# Altium project OFP_VIM_v1.51.PrjPcb (part 3 of 3)
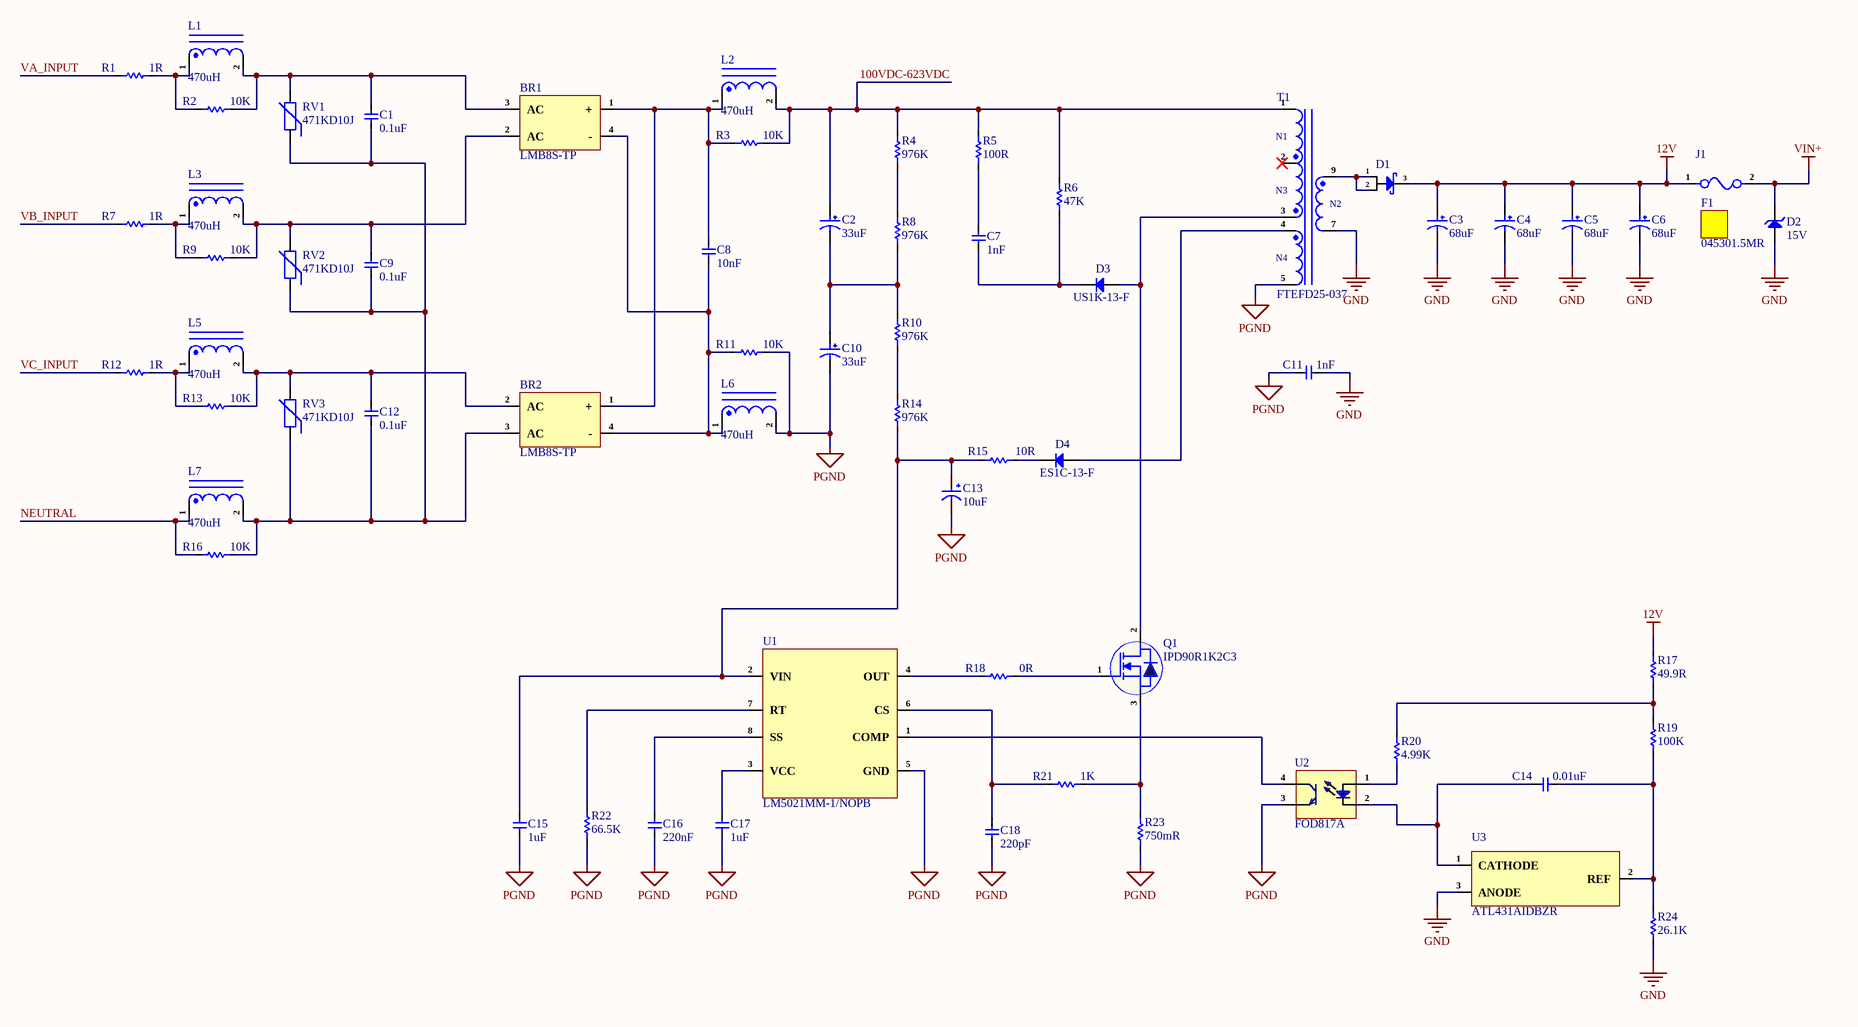
[diagram p3: Power-Supply-Sheet.SchDoc]

## Sheet Power-Supply-Sheet.SchDoc (continued)

### Library data of the parts (continued)
R24 = RT0603BRD0726K1L: RES SMD 26.1KOHM 0.1% 1/10W 0603; Manufacturer: Yageo; Item Type: Resistors; Supplier: Future Electronics; LCSC Part Number: C728586; Manufacturer Part Number: RT0603BRD0726K1L; RoHS: Yes; Stock: 40000; Pricing: 5000=0.0192, 15000=0.0188, 20000=0.0186, 50000=0.0183, 75000=0.0179 (USD); ComponentLink1URL: https://datasheet.ciiva.com/12809/pyu-rt-1-to-0-05-rohs-l-4-12809765.pdf?src-supplier=Mouser; ComponentLink1Description: https://datasheet.ciiva.com/12809/pyu-rt-1-to-0-05-rohs-l-4-12809765.pdf?src-supplier=Mouser; ComponentLink2URL: https://datasheet.ciiva.com/8889/pyu-rt-1-to-0-05-rohs-l-4-8889966.pdf?src-supplier=Avnet; ComponentLink2Description: https://datasheet.ciiva.com/8889/pyu-rt-1-to-0-05-rohs-l-4-8889966.pdf?src-supplier=Avnet
RV1-RV3 = 471KD10J: 775V 385V 300V 470V Plugin Varistors ROHS; Manufacturer: Yageo; Supplier: Mouser; LCSC Part Number: C522648; Manufacturer Part Number: 471KD10J; RoHS: Yes; Item Type: Varistors; Stock: 1519; Pricing: 1=0.43, 10=0.27, 50=0.27, 100=0.187, 1000=0.145, 10000=0.096 (USD)
T1 = FTEFD25-037: 12V/1.5A transformer; Manufacturer Part Number: FTEFD25-037; Package: Custom; Item Type: Transformer
U1 = LM5021MM-1/NOPB: IC OFFLINE SW MULT TOP 8VSSOP; Manufacturer: TI National Semiconductor; Frequency: 500kHz; Output Voltage: 600mV; Output Current: 100mA; Switching Frequency: 1MHz; Quiescent Current: 2.5mA; Topology: Flyback; Max Supply Voltage: 30V; Min Supply Voltage: 8V; Rise Time: 25ns; Fall Time: 10ns; Duty Cycle: 80%; Nominal Supply Voltage: 15V; Supplier: Mouser; LCSC Part Number: C202233; Manufacturer Part Number: LM5021MM-1/NOPB; RoHS: Yes; Item Type: IC; Stock: 1237; Pricing: 1=1.4, 10=1.04, 50=1.04, 100=0.968, 1000=0.887, 10000=0.856 (USD); Mounting Technology: Surface Mount; Case/Package: MSOP; Pins: 8; Min Operating Temperature: -40°C; Max Operating Temperature: 125°C; Packaging: Tape and Reel; Termination: SMD/SMT; Series: -; Thickness: 970um; Reach SVHC Compliant: No; Lead Free: Lead Free; RoHS Compliant: Yes; ComponentLink1URL: https://datasheet.ciiva.com/1513/1771307-1513330.pdf?src-supplier=Element14; ComponentLink1Description: https://datasheet.ciiva.com/1513/1771307-1513330.pdf?src-supplier=Element14; ComponentLink2URL: https://datasheet.ciiva.com/49118/1767118-49118582.pdf?src-supplier=Element14; ComponentLink2Description: https://datasheet.ciiva.com/49118/1767118-49118582.pdf?src-supplier=Element14; ComponentLink3URL: https://datasheet.ciiva.com/49118/1767118-49118263.pdf?src-supplier=Element14; ComponentLink3Description: https://datasheet.ciiva.com/49118/1767118-49118263.pdf?src-supplier=Element14; ComponentLink4URL: https://datasheet.ciiva.com/46389/1888908-46389836.pdf?src-supplier=Element14; ComponentLink4Description: https://datasheet.ciiva.com/46389/1888908-46389836.pdf?src-supplier=Element14; ComponentLink5URL: https://datasheet.ciiva.com/6613/lm5021-6613338.pdf?src-supplier=Digikey; ComponentLink5Description: https://datasheet.ciiva.com/6613/lm5021-6613338.pdf?src-supplier=Digikey; ComponentLink6URL: https://datasheet.ciiva.com/6613/lm5021-6613340.pdf?src-supplier=Digikey; ComponentLink6Description: https://datasheet.ciiva.com/6613/lm5021-6613340.pdf?src-supplier=Digikey; ComponentLink7URL: https://datasheet.ciiva.com/6613/lm5021-6613336.pdf?src-supplier=Digikey; ComponentLink7Description: https://datasheet.ciiva.com/6613/lm5021-6613336.pdf?src-supplier=Digikey
U2 = FOD817A: OPTOISOLATOR 5KV TRANSISTOR 4DIP; Manufacturer: ON Semiconductor / Fairchild; Item Type: IC; Supplier: Future Electronics; LCSC Part Number: C900909; Manufacturer Part Number: FOD817A; RoHS: Yes; Stock: 9100; Pricing: 100=0.0832, 500=0.0801, 2500=0.0771, 10000=0.0747, 25000=0.0712 (USD); ComponentLink1URL: https://datasheet.ciiva.com/25620/0900766b810e24fa-25620684.pdf?src-supplier=Rs; ComponentLink1Description: https://datasheet.ciiva.com/25620/0900766b810e24fa-25620684.pdf?src-supplier=Rs; ComponentLink2URL: https://datasheet.ciiva.com/15118/getdatasheetpartid-67083-15118459.pdf?src-supplier=Verical; ComponentLink2Description: https://datasheet.ciiva.com/15118/getdatasheetpartid-67083-15118459.pdf?src-supplier=Verical; ComponentLink3URL: https://datasheet.ciiva.com/27056/2016920-27056231.pdf?src-supplier=Jameco; ComponentLink3Description: https://datasheet.ciiva.com/27056/2016920-27056231.pdf?src-supplier=Jameco; ComponentLink4URL: https://datasheet.ciiva.com/12239/fod817a-12239227.pdf?src-supplier=Mouser; ComponentLink4Description: https://datasheet.ciiva.com/12239/fod817a-12239227.pdf?src-supplier=Mouser; ComponentLink5URL: https://datasheet.ciiva.com/8095/fod817d-8095131.pdf?src-supplier=Avnet; ComponentLink5Description: https://datasheet.ciiva.com/8095/fod817d-8095131.pdf?src-supplier=Avnet; ComponentLink6URL: https://datasheet.ciiva.com/2086/fod814a-2086034.pdf?src-supplier=Digikey; ComponentLink6Description: https://datasheet.ciiva.com/2086/fod814a-2086034.pdf?src-supplier=Digikey; ComponentLink7URL: https://datasheet.ciiva.com/16741/fod817-16741992.pdf?src-supplier=Future+Electronics; ComponentLink7Description: https://datasheet.ciiva.com/16741/fod817-16741992.pdf?src-supplier=Future+Electronics
U3 = ATL431AIDBZR: IC VREF SHUNT ADJ 1% SOT23-3; Manufacturer: Texas Instruments; Supplier: Mouser; LCSC Part Number: C134067; Manufacturer Part Number: ATL431AIDBZR; RoHS: Yes; Item Type: IC; Stock: 1938; Pricing: 1=0.41, 10=0.252, 50=0.252, 100=0.202, 1000=0.184, 10000=0.15 (USD); Length: 2.92mm; Width: 1.3mm; Height: 1.22mm; Thickness: 1mm; Lead Free: 5697LeadFree; ComponentLink1URL: http://www.ti.com/general/docs/lit/getliterature.tsp?genericPartNumber=ATL431&&fileType=pdf&src-supplier=Element14; ComponentLink1Description: http://www.ti.com/general/docs/lit/getliterature.tsp?genericPartNumber=ATL431&&fileType=pdf&src-supplier=Element14; ComponentLink2URL: http://www.ti.com/general/docs/lit/getliterature.tsp?genericPartNumber=ATL431&amp;&amp;fileType=pdf&src-supplier=Element14; ComponentLink2Description: http://www.ti.com/general/docs/lit/getliterature.tsp?genericPartNumber=ATL431&amp;&amp;fileType=pdf&src-supplier=Element14; ComponentLink3URL: http://www.ti.com/lit/ds/symlink/atl431.pdf?src-supplier=Digikey; ComponentLink3Description: http://www.ti.com/lit/ds/symlink/atl431.pdf?src-supplier=Digikey; ComponentLink4URL: http://www.ti.com/general/docs/lit/getliterature.tsp?genericPartNumber=ATL432&&fileType=pdf&src-supplier=Avnet; ComponentLink4Description: http://www.ti.com/general/docs/lit/getliterature.tsp?genericPartNumber=ATL432&&fileType=pdf&src-supplier=Avnet; ComponentLink5URL: http://www.ti.com/general/docs/lit/getliterature.tsp?genericPartNumber=ATL431&&fileType=pdf&src-supplier=Farnell; ComponentLink5Description: http://www.ti.com/general/docs/lit/getliterature.tsp?genericPartNumber=ATL431&&fileType=pdf&src-supplier=Farnell

## Sheet INPUT-Connectors-Sheet.SchDoc
size 420 x 297 mm; SheetNumber: 2; SheetTotal: 2
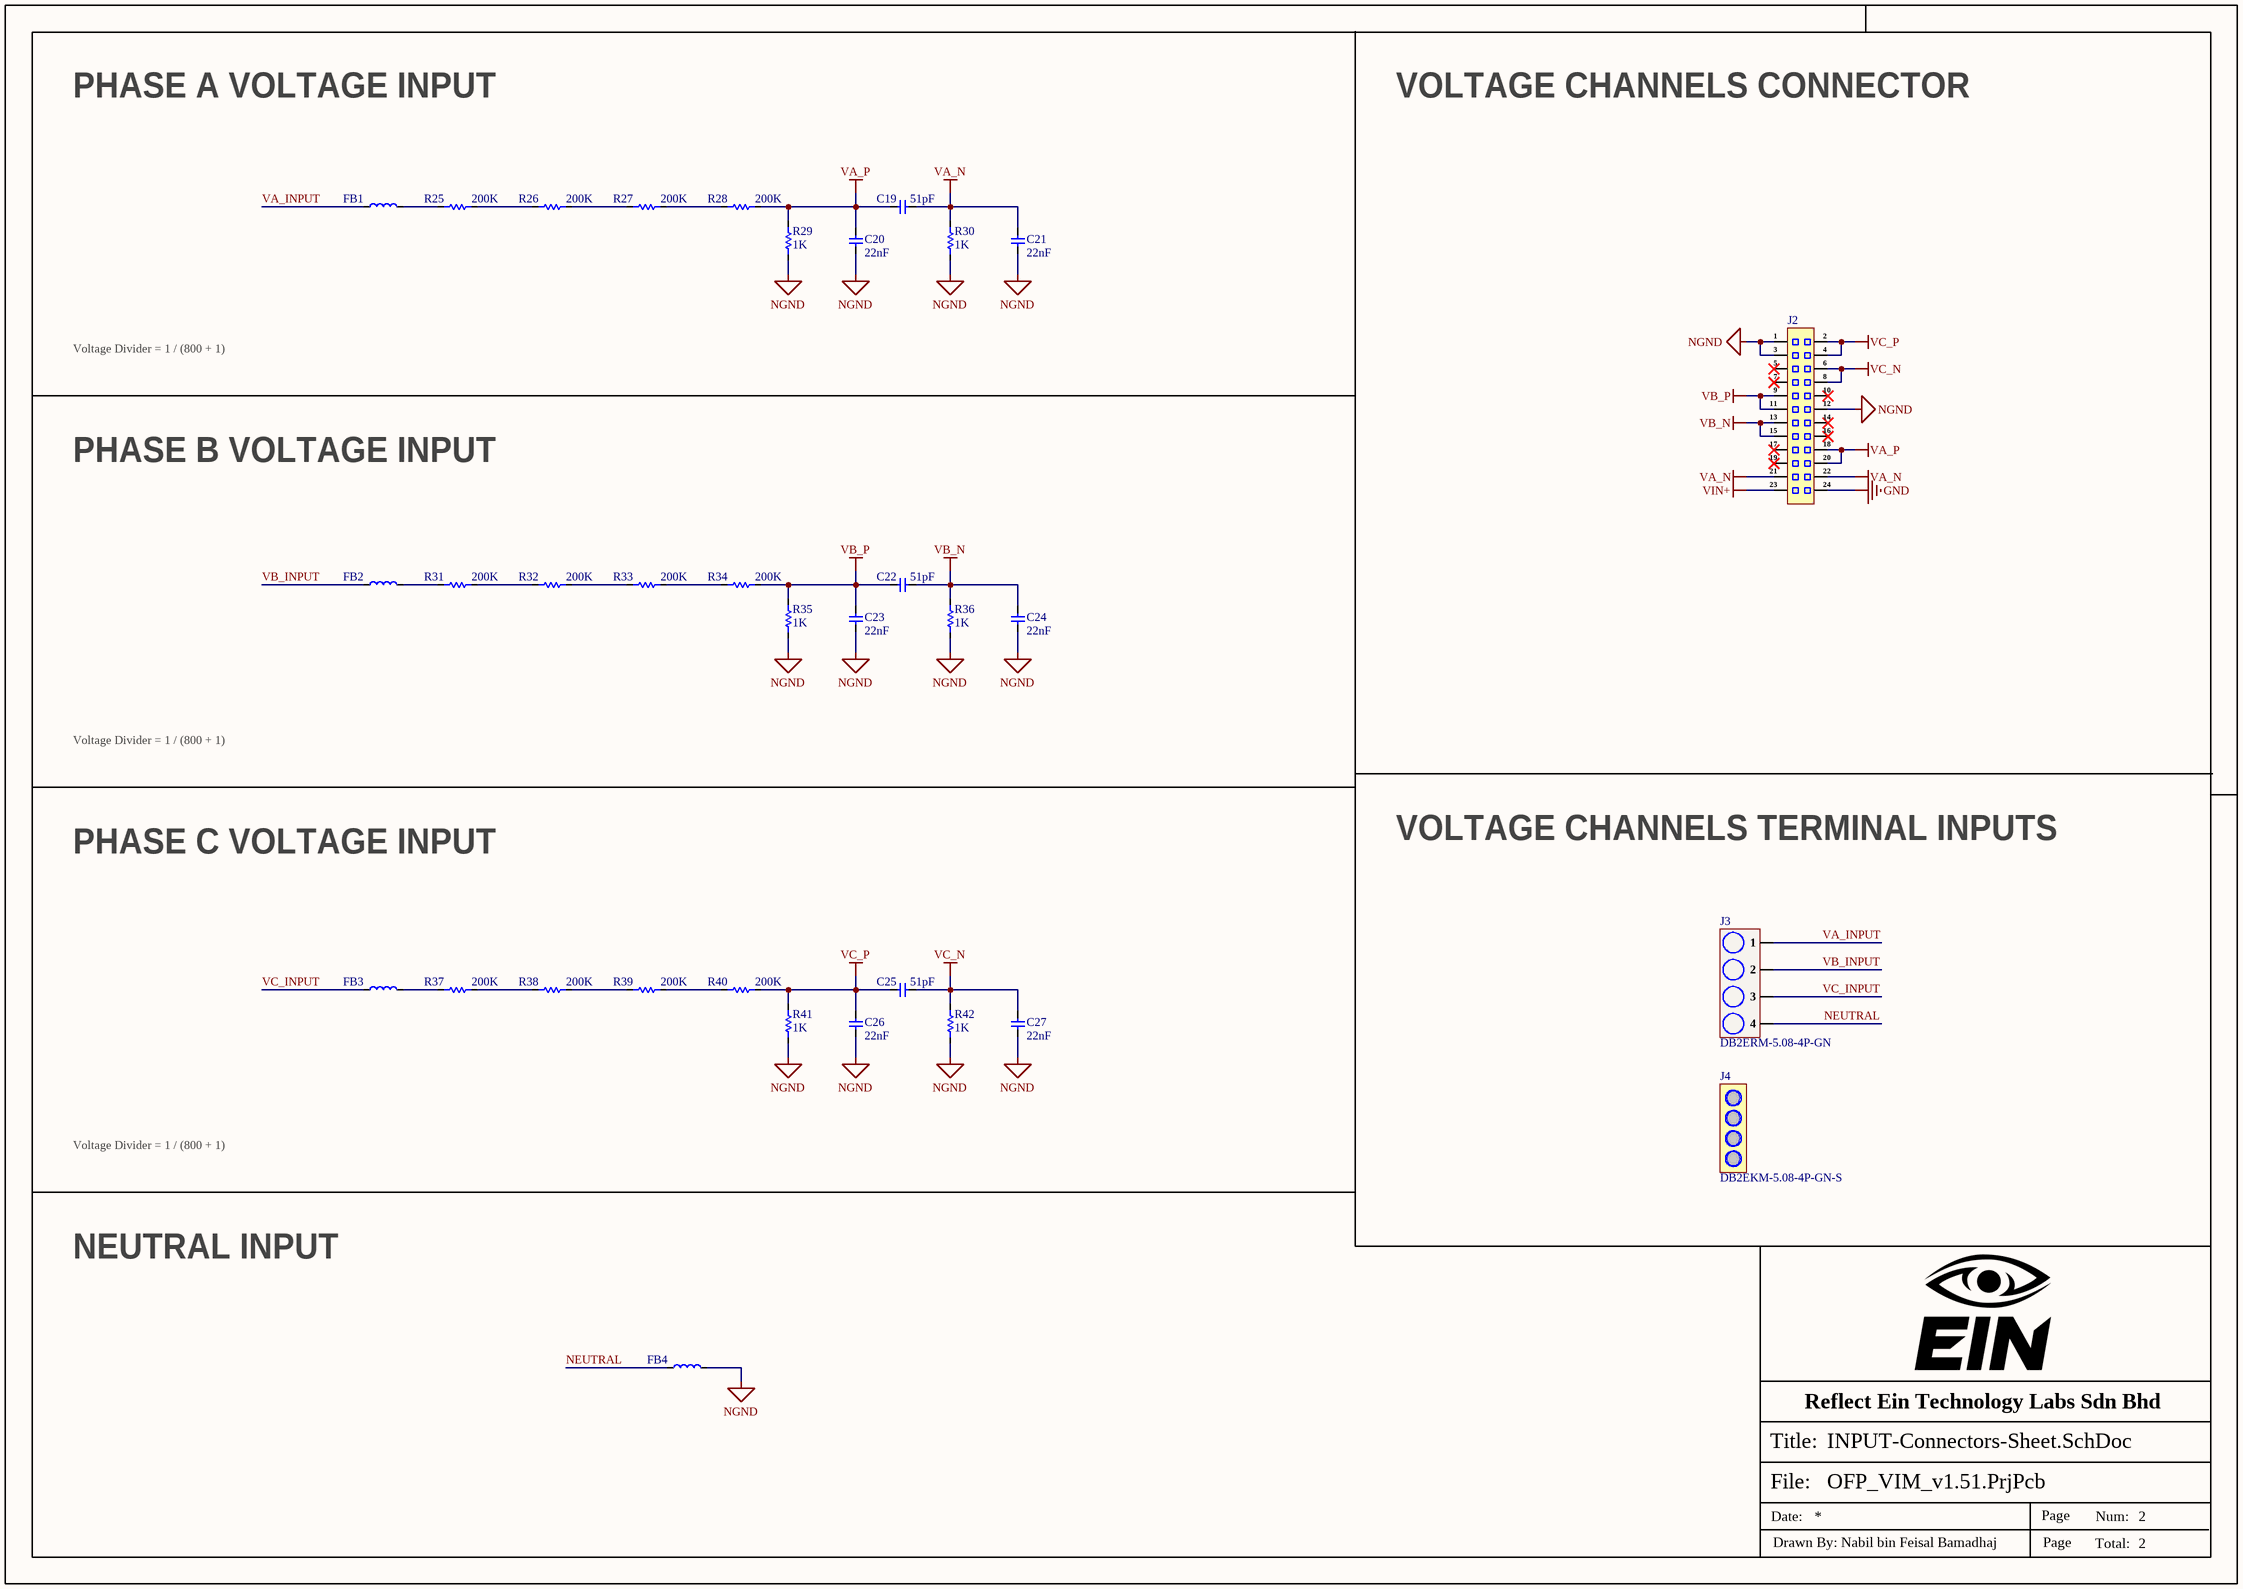
[diagram p1: INPUT-Connectors-Sheet.SchDoc]

### Parts
C19  51pF  [Cap-0603]
C20  22nF  [Cap-1206]
C21  22nF  [Cap-1206]
C22  51pF  [Cap-0603]
C23  22nF  [Cap-1206]
C24  22nF  [Cap-1206]
C25  51pF  [Cap-0603]
C26  22nF  [Cap-1206]
C27  22nF  [Cap-1206]
FB1  BLM21BD152SN1D  [Ind-0805]  (value not drawn)
FB2  BLM21BD152SN1D  [Ind-0805]  (value not drawn)
FB3  BLM21BD152SN1D  [Ind-0805]  (value not drawn)
FB4  BLM21BD152SN1D  [Ind-0805]  (value not drawn)
J2  SFH11-PBPC-D12-RA-BK  [SFH11-PBPC-D12-RA-BK]  (value not drawn)
J3  DB2ERM-5.08-4P-GN  [DB2ERM-5.08-4P-GN]
J4  DB2EKM-5.08-4P-GN-S  (mechanical)
R25  200K  [RES-2512]
R26  200K  [RES-2512]
R27  200K  [RES-2512]
R28  200K  [RES-2512]
R29  1K  [RES-2512]
R30  1K  [RES-2512]
R31  200K  [RES-2512]
R32  200K  [RES-2512]
R33  200K  [RES-2512]
R34  200K  [RES-2512]
R35  1K  [RES-2512]
R36  1K  [RES-2512]
R37  200K  [RES-2512]
R38  200K  [RES-2512]
R39  200K  [RES-2512]
R40  200K  [RES-2512]
R41  1K  [RES-2512]
R42  1K  [RES-2512]

### Nets
GND: J2.24
NGND: C20.1 C21.1 C23.1 C24.1 C26.1 C27.1 FB4.2 J2.1 J2.3 J2.12 R29.1 R30.1 R35.1 R36.1 R41.1 R42.1
VA_N: C19.2 C21.2 J2.21 J2.22 R30.2
VA_P: C19.1 C20.2 J2.18 J2.20 R28.2 R29.2
VB_N: C22.2 C24.2 J2.13 J2.15 R36.2
VB_P: C22.1 C23.2 J2.9 J2.11 R34.2 R35.2
VC_N: C25.2 C27.2 J2.6 J2.8 R42.2
VC_P: C25.1 C26.2 J2.2 J2.4 R40.2 R41.2
VIN+: J2.23
NEUTRAL: FB4.1 J3.4
VA_INPUT: FB1.1 J3.1
VB_INPUT: FB2.1 J3.2
VC_INPUT: FB3.1 J3.3
NetFB1_2: FB1.2 R25.1
NetFB2_2: FB2.2 R31.1
NetFB3_2: FB3.2 R37.1
NetR25_2: R25.2 R26.1
NetR26_2: R26.2 R27.1
NetR27_2: R27.2 R28.1
NetR31_2: R31.2 R32.1
NetR32_2: R32.2 R33.1
NetR33_2: R33.2 R34.1
NetR37_2: R37.2 R38.1
NetR38_2: R38.2 R39.1
NetR39_2: R39.2 R40.1

Not connected (* = marked no-connect by the designer): J2 5* 7* 10* 14* 16* 17* 19*

### Notes on the sheet
- PHASE A VOLTAGE INPUT
- VOLTAGE CHANNELS CONNECTOR
- Voltage Divider = 1 / (800 + 1)
- PHASE B VOLTAGE INPUT
- PHASE C VOLTAGE INPUT
- VOLTAGE CHANNELS TERMINAL INPUTS
- NEUTRAL INPUT
- Reflect Ein Technology Labs Sdn Bhd
- File:
- Title:
- Date:
- Page
- Num:
- Total:
- Drawn By: Nabil bin Feisal Bamadhaj

### Library data of the parts
C19 C22 C25 = GQM1875C2E510FB12D: 51 pF ±1% 250V Ceramic Capacitor C0G, NP0 0603 (1608 Metric); Manufacturer: Murata; Item Type: Capacitors; Supplier: Mouser; LCSC Part Number: C17504198; Manufacturer Part Number: GQM1875C2E510FB12D; RoHS: Yes; Stock: 1634; Pricing: 1=0.58, 10=0.26, 50=0.26, 100=0.181, 1000=0.16, 10000=0.122 (USD)
C20 C21 C23 C24 C26 C27 = CC1206KKX7RBBB223: CAP CER 0.022UF 500V X7R 1206; Manufacturer: Yageo; Item Type: Capacitors; Supplier: Future Electronics; LCSC Part Number: C326702; Manufacturer Part Number: CC1206KKX7RBBB223; RoHS: Yes; Stock: 660000; Pricing: 3000=0.0421, 6000=0.0414, 12000=0.0407, 15000=0.0405, 45000=0.0392 (USD); Lead Free: 5697LeadFree; ComponentLink1URL: http://www.mouser.com/ds/2/447/Yageo_UPY-GP_NP0_16V-to-50V_9-358835.pdf?src-supplier=Mouser; ComponentLink1Description: http://www.mouser.com/ds/2/447/Yageo_UPY-GP_NP0_16V-to-50V_9-358835.pdf?src-supplier=Mouser; ComponentLink2URL: http://www.yageo.com/documents/recent/UPY-NP0X7R_MV_100-to-630V_9.pdf?src-supplier=Avnet; ComponentLink2Description: http://www.yageo.com/documents/recent/UPY-NP0X7R_MV_100-to-630V_9.pdf?src-supplier=Avnet; ComponentLink3URL: http://www.yageo.com/documents/recent/UPY-NP0X7R_MV_100-to-630V_19.pdf?src-supplier=Digikey; ComponentLink3Description: http://www.yageo.com/documents/recent/UPY-NP0X7R_MV_100-to-630V_19.pdf?src-supplier=Digikey; ComponentLink4URL: http://www.yageo.com/documents/recent/UPY-NP0X7R_MV_100-to-630V_21.pdf?src-supplier=Digikey; ComponentLink4Description: http://www.yageo.com/documents/recent/UPY-NP0X7R_MV_100-to-630V_21.pdf?src-supplier=Digikey; ComponentLink5URL: https://www.yageo.com/upload/media/product/products/datasheet/mlcc/UPY-NP0X7R_MV_100-to-630V_21.pdf?src-supplier=Digikey; ComponentLink5Description: https://www.yageo.com/upload/media/product/products/datasheet/mlcc/UPY-NP0X7R_MV_100-to-630V_21.pdf?src-supplier=Digikey; ComponentLink6URL: http://www.yageo.com/documents/recent/UPY-NP0X7R_MV_100-to-630V_9.pdf?src-supplier=Future+Electronics; ComponentLink6Description: http://www.yageo.com/documents/recent/UPY-NP0X7R_MV_100-to-630V_9.pdf?src-supplier=Future+Electronics; ComponentLink7URL: https://datasheet.octopart.com/CC1206KKX7RBBB223-Yageo-datasheet-10979222.pdf?src-supplier=Future+Electronics; ComponentLink7Description: https://datasheet.octopart.com/CC1206KKX7RBBB223-Yageo-datasheet-10979222.pdf?src-supplier=Future+Electronics
FB1-FB4 = BLM21BD152SN1D: FERRITE BEAD 1.5 KOHM 0805 1LN; Manufacturer: Murata; Item Type: Ferrite Beads; RMS Current (Irms): 250mA; ESR: 450mR; Shielding: 202Shielding; Frequency: 100MHz; Number of Circuits: 1NUMBER; Supplier: Mouser; LCSC Part Number: C413959; Manufacturer Part Number: BLM21BD152SN1D; RoHS: Yes; Stock: 31999; Pricing: 1=0.21, 10=0.114, 50=0.114, 100=0.102, 1000=0.068, 10000=0.048 (USD); Lead Free: 5697LeadFree; ComponentLink1URL: https://datasheet.ciiva.com/19454/1845267-19454720.pdf?src-supplier=Jameco; ComponentLink1Description: https://datasheet.ciiva.com/19454/1845267-19454720.pdf?src-supplier=Jameco; ComponentLink2URL: https://datasheet.ciiva.com/14122/amblm21b-data-e-14122891.pdf?src-supplier=Distrelec; ComponentLink2Description: https://datasheet.ciiva.com/14122/amblm21b-data-e-14122891.pdf?src-supplier=Distrelec; ComponentLink3URL: https://datasheet.ciiva.com/6211/l0110s0100blm21b-6211484.pdf?src-supplier=Digikey; ComponentLink3Description: https://datasheet.ciiva.com/6211/l0110s0100blm21b-6211484.pdf?src-supplier=Digikey; ComponentLink4URL: https://datasheet.ciiva.com/6211/l0110s0100blm21b-6211486.pdf?src-supplier=Digikey; ComponentLink4Description: https://datasheet.ciiva.com/6211/l0110s0100blm21b-6211486.pdf?src-supplier=Digikey; ComponentLink5URL: https://datasheet.ciiva.com/6211/l0110s0100blm21b-6211487.pdf?src-supplier=Digikey; ComponentLink5Description: https://datasheet.ciiva.com/6211/l0110s0100blm21b-6211487.pdf?src-supplier=Digikey; ComponentLink6URL: https://datasheet.ciiva.com/16420/l0110s0100blm21b-16420715.pdf?src-supplier=Future+Electronics; ComponentLink6Description: https://datasheet.ciiva.com/16420/l0110s0100blm21b-16420715.pdf?src-supplier=Future+Electronics; ComponentLink7URL: https://datasheet.ciiva.com/17277/l0110s0100blm21b-17277370.pdf?; ComponentLink7Description: https://datasheet.ciiva.com/17277/l0110s0100blm21b-17277370.pdf?
J2 = SFH11-PBPC-D12-RA-BK: CONN HDR 24POS 0.1 GOLD PCB R/A; Manufacturer: Sullins; Item Type: Connectors; Number of Positions: 24; Connector Type: Header; Pitch: 0.1inch; Supplier: Digikey; Manufacturer Part Number: SFH11-PBPC-D12-RA-BK; RoHS: Yes; Pricing: 1000=0.8853 (USD); Mounting Technology: Through Hole; Color: Black; Contact Plating: Gold; Package Quantity: 1000; Packaging: Tray; Number of Rows: 2; Termination: Solder; Series: SFH11; Contact Type: Female Socket; Row Spacing: 0.1inch; RoHS Compliant: Yes; ComponentLink1URL: http://sullinscorp.com/catalogs/147_PAGE119_.100_SFH11_SERIES_FEMALE_HDR_ST_RA.pdf?src-supplier=Digikey; ComponentLink1Description: http://sullinscorp.com/catalogs/147_PAGE119_.100_SFH11_SERIES_FEMALE_HDR_ST_RA.pdf?src-supplier=Digikey
J3 = DB2ERM-5.08-4P-GN: 320V 20A 4 Bend -40℃~+105℃ 1 5.08mm 1x4P Green Receptacle-Close Screw Fixing Push-Pull,P=5.08mm Pluggable System Terminal Block ROHS; Manufacturer: DORABO; Manufacturer Part Number: DB2ERM-5.08-4P-GN; Package: Push-Pull,P=5.08mm; LCSC Part Number: C395755; Item Type: Terminal Block; ComponentLink1Description: LCSC; ComponentLink1URL: https://www.lcsc.com/product-detail/Pluggable-System-Terminal-Block_DORABO-DB2ERM-5-08-4P-GN_C395755.html?s_z=n_DB2ERM-5.08-4P-GN
J4 = DB2EKM-5.08-4P-GN-S: -40℃~+105℃ 2.5 1 14~28 5.08mm 320V 20A 4 1x4P Green Plug Screw Fixing P=5.08mm Pluggable System Terminal Block ROHS; Manufacturer: DORABO; Manufacturer Part Number: DB2EKM-5.08-4P-GN-S; Package: P=5.08mm; LCSC Part Number: C395756; Item Type: Terminal Block; ComponentLink1Description: LCSC; ComponentLink1URL: https://www.lcsc.com/product-detail/Pluggable-System-Terminal-Block_DORABO-DB2EKM-5-08-4P-GN-S_C395756.html?s_z=n_DB2EKM-5.08-4P-GN-S
R25-R28 R31-R34 R37-R40 = CRCW2512200KFKEG: RES SMD 200K OHM 1% 1W 2512; Manufacturer: Vishay Dale; Item Type: Resistors; Voltage Rating (DC): 500V; Supplier: Mouser; LCSC Part Number: C2078538; Manufacturer Part Number: CRCW2512200KFKEG; RoHS: Yes; Stock: 29311; Pricing: 1=0.3, 10=0.127, 50=0.127, 100=0.082, 1000=0.067, 10000=0.047 (USD); Lead Free: 5697LeadFree; ComponentLink1URL: https://datasheet.ciiva.com/16435/dcrcwe3-16435690.pdf?src-supplier=Future+Electronics; ComponentLink1Description: https://datasheet.ciiva.com/16435/dcrcwe3-16435690.pdf?src-supplier=Future+Electronics; ComponentLink2URL: https://datasheet.ciiva.com/5545/dcrcwe3-109170-5545692.pdf?src-supplier=Mouser; ComponentLink2Description: https://datasheet.ciiva.com/5545/dcrcwe3-109170-5545692.pdf?src-supplier=Mouser
R29 R30 R35 R36 R41 R42 = RC2512JK-071KL: RES 1K OHM 5% 1W 2512; Manufacturer: Yageo; Value: 1kR; Voltage Rating: 200V; Temperature Coefficient: 100ppm/°C; Item Type: Resistor; Supplier: Future Electronics; Supplier Part Number: 9067984; Manufacturer Part Number: RC2512JK-071KL; RoHS: Yes; Category: Chip SMD Resistors; Stock: 596000; Pricing: 4000=0.0216, 16000=0.0207, 40000=0.0201, 100000=0.0195, 160000=0.0187 (USD); Case/Package: 2512; Case Code (Imperial): 2512; Case Code (Metric): 6432; Contact Plating: Tin,Lead; Min Operating Temperature: -55°C; Max Operating Temperature: 155°C; Power Rating: 1W; Packaging: Tape and Reel; Tolerance: 5%; Resistor Type: Thick Film; Number of Terminations: 2; Termination: SMD/SMT; Max Power Dissipation: 1W; Working Voltage: 200V; Features: Moisture Resistant; Series: RC; Technology: THICK FILM; Resistance Tolerance: 5%; Length: 0.25inch; Width: 3.1mm; Height: 0.026inch; RoHS Compliant: Yes; Reach SVHC Compliant: Unknown; Lead Free: 5697LeadFree; ComponentLink1URL: https://datasheet.ciiva.com/5595/pyu-rc2512-51-rohs-l-4-5595927.pdf?src-supplier=Mouser; ComponentLink1Description: https://datasheet.ciiva.com/5595/pyu-rc2512-51-rohs-l-4-5595927.pdf?src-supplier=Mouser; ComponentLink2URL: https://datasheet.ciiva.com/7672/638316-7672039.pdf?src-supplier=Element14; ComponentLink2Description: https://datasheet.ciiva.com/7672/638316-7672039.pdf?src-supplier=Element14; ComponentLink3URL: https://datasheet.ciiva.com/7672/638316-7672038.pdf?src-supplier=Element14; ComponentLink3Description: https://datasheet.ciiva.com/7672/638316-7672038.pdf?src-supplier=Element14; LCSC Part Number: C137010

## Nets that join several sheets
GND: Power-Supply-Sheet (9 pins), INPUT-Connectors-Sheet (J2.24)
VIN+: Power-Supply-Sheet (D2.2 J1.2), INPUT-Connectors-Sheet (J2.23)
NEUTRAL: Power-Supply-Sheet (L7.1 R16.1), INPUT-Connectors-Sheet (FB4.1 J3.4)
VA_INPUT: Power-Supply-Sheet (R1.1), INPUT-Connectors-Sheet (FB1.1 J3.1)
VB_INPUT: Power-Supply-Sheet (R7.1), INPUT-Connectors-Sheet (FB2.1 J3.2)
VC_INPUT: Power-Supply-Sheet (R12.1), INPUT-Connectors-Sheet (FB3.1 J3.3)